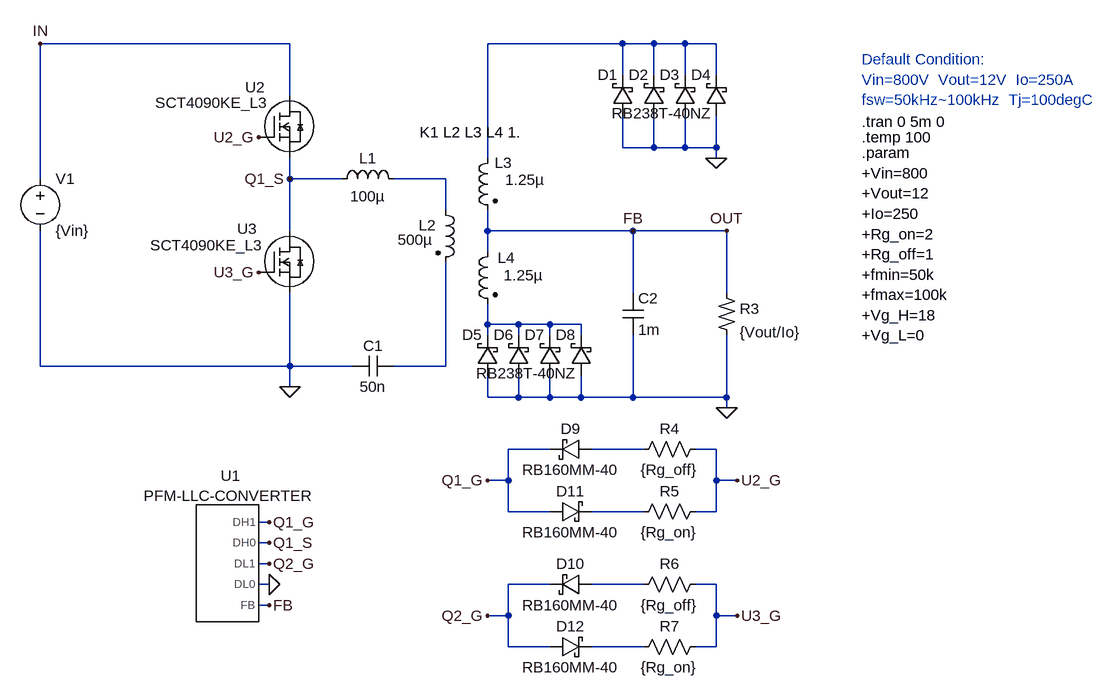
[diagram p0: schematic DC-DC LLC Buck Converter Vo=12V Io=250A.asc]
DC-DC LLC Buck Converter Vo=12V Io=250A.asc, the LTspice schematic file:
Version 4.1
SHEET 1 1656 680
WIRE -304 -416 -688 -416
WIRE 208 -416 0 -416
WIRE 256 -416 208 -416
WIRE 304 -416 256 -416
WIRE 352 -416 304 -416
WIRE 208 -368 208 -416
WIRE 256 -368 256 -416
WIRE 304 -368 304 -416
WIRE 352 -368 352 -416
WIRE -304 -336 -304 -416
WIRE 208 -256 208 -304
WIRE 256 -256 256 -304
WIRE 256 -256 208 -256
WIRE 304 -256 304 -304
WIRE 304 -256 256 -256
WIRE 352 -256 352 -304
WIRE 352 -256 304 -256
WIRE 0 -240 0 -416
WIRE 352 -240 352 -256
WIRE -688 -208 -688 -416
WIRE -304 -208 -304 -240
WIRE -224 -208 -304 -208
WIRE -64 -208 -144 -208
WIRE -64 -160 -64 -208
WIRE -304 -128 -304 -208
WIRE 0 -128 0 -160
WIRE 224 -128 0 -128
WIRE 368 -128 224 -128
WIRE 0 -96 0 -128
WIRE 224 -32 224 -128
WIRE 368 -32 368 -128
WIRE 0 16 0 -16
WIRE 48 16 0 16
WIRE 96 16 48 16
WIRE 144 16 96 16
WIRE 0 32 0 16
WIRE 48 32 48 16
WIRE 96 32 96 16
WIRE 144 32 144 16
WIRE -688 80 -688 -128
WIRE -304 80 -304 -32
WIRE -304 80 -688 80
WIRE -208 80 -304 80
WIRE -64 80 -64 -80
WIRE -64 80 -144 80
WIRE -304 112 -304 80
WIRE 0 128 0 96
WIRE 48 128 48 96
WIRE 48 128 0 128
WIRE 96 128 96 96
WIRE 96 128 48 128
WIRE 144 128 144 96
WIRE 144 128 96 128
WIRE 224 128 224 32
WIRE 224 128 144 128
WIRE 368 128 368 32
WIRE 368 128 224 128
WIRE 368 144 368 128
WIRE 96 208 32 208
WIRE 240 208 160 208
WIRE 352 208 320 208
WIRE 32 256 32 208
WIRE 32 256 0 256
WIRE 352 256 352 208
WIRE 384 256 352 256
WIRE 32 304 32 256
WIRE 96 304 32 304
WIRE 240 304 160 304
WIRE 352 304 352 256
WIRE 352 304 320 304
WIRE -336 320 -352 320
WIRE -336 352 -352 352
WIRE -336 384 -352 384
WIRE -336 416 -352 416
WIRE 96 416 32 416
WIRE 240 416 160 416
WIRE 352 416 320 416
WIRE -336 448 -352 448
WIRE 32 464 32 416
WIRE 32 464 0 464
WIRE 352 464 352 416
WIRE 384 464 352 464
WIRE 32 512 32 464
WIRE 96 512 32 512
WIRE 240 512 160 512
WIRE 352 512 352 464
WIRE 352 512 320 512
FLAG 368 -128 OUT
FLAG -304 112 0
FLAG 352 -240 0
FLAG 368 144 0
FLAG -688 -416 IN
FLAG -336 448 FB
FLAG 224 -128 FB
FLAG -352 -272 U2_G
FLAG -352 -64 U3_G
FLAG -304 -208 Q1_S
FLAG -336 320 Q1_G
FLAG -336 352 Q1_S
FLAG -336 384 Q2_G
FLAG -336 416 0
FLAG 0 256 Q1_G
FLAG 384 256 U2_G
FLAG 0 464 Q2_G
FLAG 384 464 U3_G
SYMBOL ind -240 -192 R270
WINDOW 0 32 56 VTop 2
WINDOW 3 5 56 VBottom 2
SYMATTR InstName L1
SYMATTR Value 100µ
SYMBOL voltage -688 -224 R0
WINDOW 123 0 0 Left 2
WINDOW 39 0 0 Left 2
SYMATTR InstName V1
SYMATTR Value {Vin}
SYMBOL res2 352 -32 R0
SYMATTR InstName R3
SYMATTR Value {Vout/Io}
SYMBOL ind2 -80 -176 R0
WINDOW 3 -58 62 Left 2
WINDOW 0 -26 39 Left 2
SYMATTR Value 500µ
SYMATTR InstName L2
SYMATTR Type ind
SYMBOL ind2 16 -256 M0
WINDOW 0 -22 23 Left 2
WINDOW 3 -72 49 Left 2
SYMATTR InstName L3
SYMATTR Value 1.25µ
SYMATTR Type ind
SYMBOL ind2 16 -112 M0
WINDOW 0 -27 25 Left 2
WINDOW 3 -70 52 Left 2
SYMATTR InstName L4
SYMATTR Value 1.25µ
SYMATTR Type ind
SYMBOL schottky 320 -304 R180
WINDOW 0 24 64 Left 2
WINDOW 3 24 0 Invisible 2
SYMATTR InstName D3
SYMATTR Value RB238NS-40
SYMATTR Description Diode
SYMATTR Type diode
SYMBOL schottky 368 -304 R180
WINDOW 0 24 64 Left 2
WINDOW 3 24 0 Invisible 2
SYMATTR InstName D4
SYMATTR Value RB238NS-40
SYMATTR Description Diode
SYMATTR Type diode
SYMBOL schottky 64 96 R180
WINDOW 0 24 64 Left 2
WINDOW 3 24 0 Invisible 2
SYMATTR InstName D6
SYMATTR Value RB238NS-40
SYMATTR Description Diode
SYMATTR Type diode
SYMBOL schottky 112 96 R180
WINDOW 0 24 64 Left 2
WINDOW 3 24 0 Invisible 2
SYMATTR InstName D7
SYMATTR Value RB238NS-40
SYMATTR Description Diode
SYMATTR Type diode
SYMBOL schottky 160 96 R180
WINDOW 0 24 64 Left 2
WINDOW 3 24 0 Invisible 2
SYMATTR InstName D8
SYMATTR Value RB238NS-40
SYMATTR Description Diode
SYMATTR Type diode
SYMBOL cap -144 64 R90
WINDOW 0 0 32 VBottom 2
WINDOW 3 32 32 VTop 2
SYMATTR InstName C1
SYMATTR Value 50n
SYMBOL cap 208 -32 R0
SYMATTR InstName C2
SYMATTR Value 1m
SYMBOL schottky 16 96 R180
WINDOW 0 24 64 Left 2
WINDOW 3 -123 5 Left 2
SYMATTR InstName D5
SYMATTR Value RB238T-40NZ
SYMATTR Description Diode
SYMATTR Type diode
SYMBOL schottky 224 -304 R180
WINDOW 0 24 64 Left 2
WINDOW 3 -123 5 Left 2
SYMATTR InstName D1
SYMATTR Value RB238T-40NZ
SYMATTR Description Diode
SYMATTR Type diode
SYMBOL schottky 272 -304 R180
WINDOW 0 24 64 Left 2
WINDOW 3 24 0 Invisible 2
SYMATTR InstName D2
SYMATTR Value RB238NS-40
SYMATTR Description Diode
SYMATTR Type diode
SYMBOL res 336 192 R90
WINDOW 0 0 56 VBottom 2
WINDOW 3 32 56 VTop 2
SYMATTR InstName R4
SYMATTR Value {Rg_off}
SYMBOL res 336 288 R90
WINDOW 0 0 56 VBottom 2
WINDOW 3 32 56 VTop 2
SYMATTR InstName R5
SYMATTR Value {Rg_on}
SYMBOL schottky 160 192 R90
WINDOW 0 0 32 VBottom 2
WINDOW 3 32 32 VTop 2
SYMATTR InstName D9
SYMATTR Value RB160MM-40
SYMATTR Description Diode
SYMATTR Type diode
SYMBOL res 336 400 R90
WINDOW 0 0 56 VBottom 2
WINDOW 3 32 56 VTop 2
SYMATTR InstName R6
SYMATTR Value {Rg_off}
SYMBOL res 336 496 R90
WINDOW 0 0 56 VBottom 2
WINDOW 3 32 56 VTop 2
SYMATTR InstName R7
SYMATTR Value {Rg_on}
SYMBOL schottky 160 400 R90
WINDOW 0 0 32 VBottom 2
WINDOW 3 32 32 VTop 2
SYMATTR InstName D10
SYMATTR Value RB160MM-40
SYMATTR Description Diode
SYMATTR Type diode
SYMBOL schottky 96 320 R270
WINDOW 0 32 32 VTop 2
WINDOW 3 0 32 VBottom 2
SYMATTR InstName D11
SYMATTR Value RB160MM-40
SYMATTR Description Diode
SYMATTR Type diode
SYMBOL schottky 96 528 R270
WINDOW 0 32 32 VTop 2
WINDOW 3 0 32 VBottom 2
SYMATTR InstName D12
SYMATTR Value RB160MM-40
SYMATTR Description Diode
SYMATTR Type diode
SYMBOL PFM-LLC-CONVERTER -400 368 R0
WINDOW 0 5 -104 Bottom 2
WINDOW 3 2 -104 Top 2
WINDOW 39 -186 128 Invisible 2
WINDOW 40 -186 151 Invisible 2
SYMATTR InstName U1
SYMBOL SCT4090KE_L3 -352 -336 R0
WINDOW 0 -21 -13 Left 2
WINDOW 3 -159 11 Left 2
SYMATTR InstName U2
SYMBOL SCT4090KE_L3 -352 -128 R0
WINDOW 0 -33 -3 Left 2
WINDOW 3 -167 22 Left 2
SYMATTR InstName U3
TEXT 576 -248 Left 2 !.param\n+Vin=800\n+Vout=12 \n+Io=250\n+Rg_on=2\n+Rg_off=1\n+fmin=50k \n+fmax=100k\n+Vg_H=18 \n+Vg_L=0
TEXT 576 -296 Left 2 !.tran 0 5m 0
TEXT 576 -272 Left 2 !.temp 100
TEXT 576 -392 Left 2 ;Default Condition:\nVin=800V  Vout=12V  Io=250A\nfsw=50kHz~100kHz  Tj=100degC
TEXT -104 -280 Left 2 !K1 L2 L3 L4 1.

The netlist it stands for:
* DC-DC LLC Buck Converter Vo=12V Io=250A.asc
L1 Q1_S N002 100µ
V1 IN 0 {Vin}
R3 FB 0 {Vout/Io}
L2 N002 N004 500µ
L3 N001 FB 1.25µ
L4 FB N003 1.25µ
D3 0 N001 RB238NS-40
D4 0 N001 RB238NS-40
D6 0 N003 RB238NS-40
D7 0 N003 RB238NS-40
D8 0 N003 RB238NS-40
C1 N004 0 50n
C2 FB 0 1m
D5 0 N003 RB238T-40NZ
D1 0 N001 RB238T-40NZ
D2 0 N001 RB238NS-40
R4 U2_G N005 {Rg_off}
R5 U2_G N006 {Rg_on}
D9 N005 Q1_G RB160MM-40
R6 U3_G N007 {Rg_off}
R7 U3_G N008 {Rg_on}
D10 N007 Q2_G RB160MM-40
D11 Q1_G N006 RB160MM-40
D12 Q2_G N008 RB160MM-40
X§U1 Q1_G Q1_S Q2_G 0 FB PFM-LLC-CONVERTER fmin={fmin} fmax={fmax} td1=100n td2=100n tr1=10n tf1=10n tr2=10n tf2=10n Vg_H={Vg_H} Vg_L={Vg_L} Rso1=0 Rsi1=0 Rso2=0 Rsi2=0 f02=5k GA=5k Vref=0.5 ts=100u Vo=0 Vout={Vout}  ; pins DH1 DH0 DL1 DL0 FB
X§U2 IN U2_G Q1_S SCT4090KE_L3  ; pins D G S
X§U3 Q1_S U3_G 0 SCT4090KE_L3  ; pins D G S
.model D D
.lib standard.dio
.param
+Vin=800
+Vout=12
+Io=250
+Rg_on=2
+Rg_off=1
+fmin=50k
+fmax=100k
+Vg_H=18
+Vg_L=0
.tran 0 5m 0
.temp 100
* Default Condition:
* Vin=800V  Vout=12V  Io=250A
* fsw=50kHz~100kHz  Tj=100degC
K1 L2 L3 L4 1.
.lib SS PFM-LLC-CONVERTER.lib
.lib SCT4090KE_L3.lib
.backanno
.end